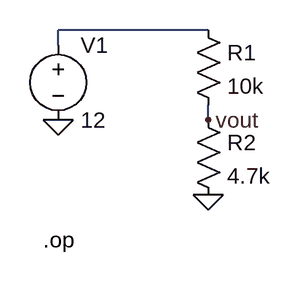
[diagram p0: schematic Divisor de voltaje.asc]
Divisor de voltaje.asc, the LTspice schematic file:
Version 4
SHEET 1 880 680
WIRE 160 0 0 0
WIRE 0 16 0 0
WIRE 160 96 160 80
FLAG 0 96 0
FLAG 160 176 0
FLAG 160 96 vout
SYMBOL voltage 0 0 R0
SYMATTR InstName V1
SYMATTR Value 12
SYMBOL res 144 -16 R0
SYMATTR InstName R1
SYMATTR Value 10k
SYMBOL res 144 80 R0
SYMATTR InstName R2
SYMATTR Value 4.7k
TEXT -16 224 Left 2 !.op

The netlist it stands for:
* Divisor de voltaje.asc
V1 N001 0 12
R1 N001 vout 10k
R2 vout 0 4.7k
.op
.backanno
.end